# Altium project MD040EVM_RevE2.PrjPCB (part 4 of 4)
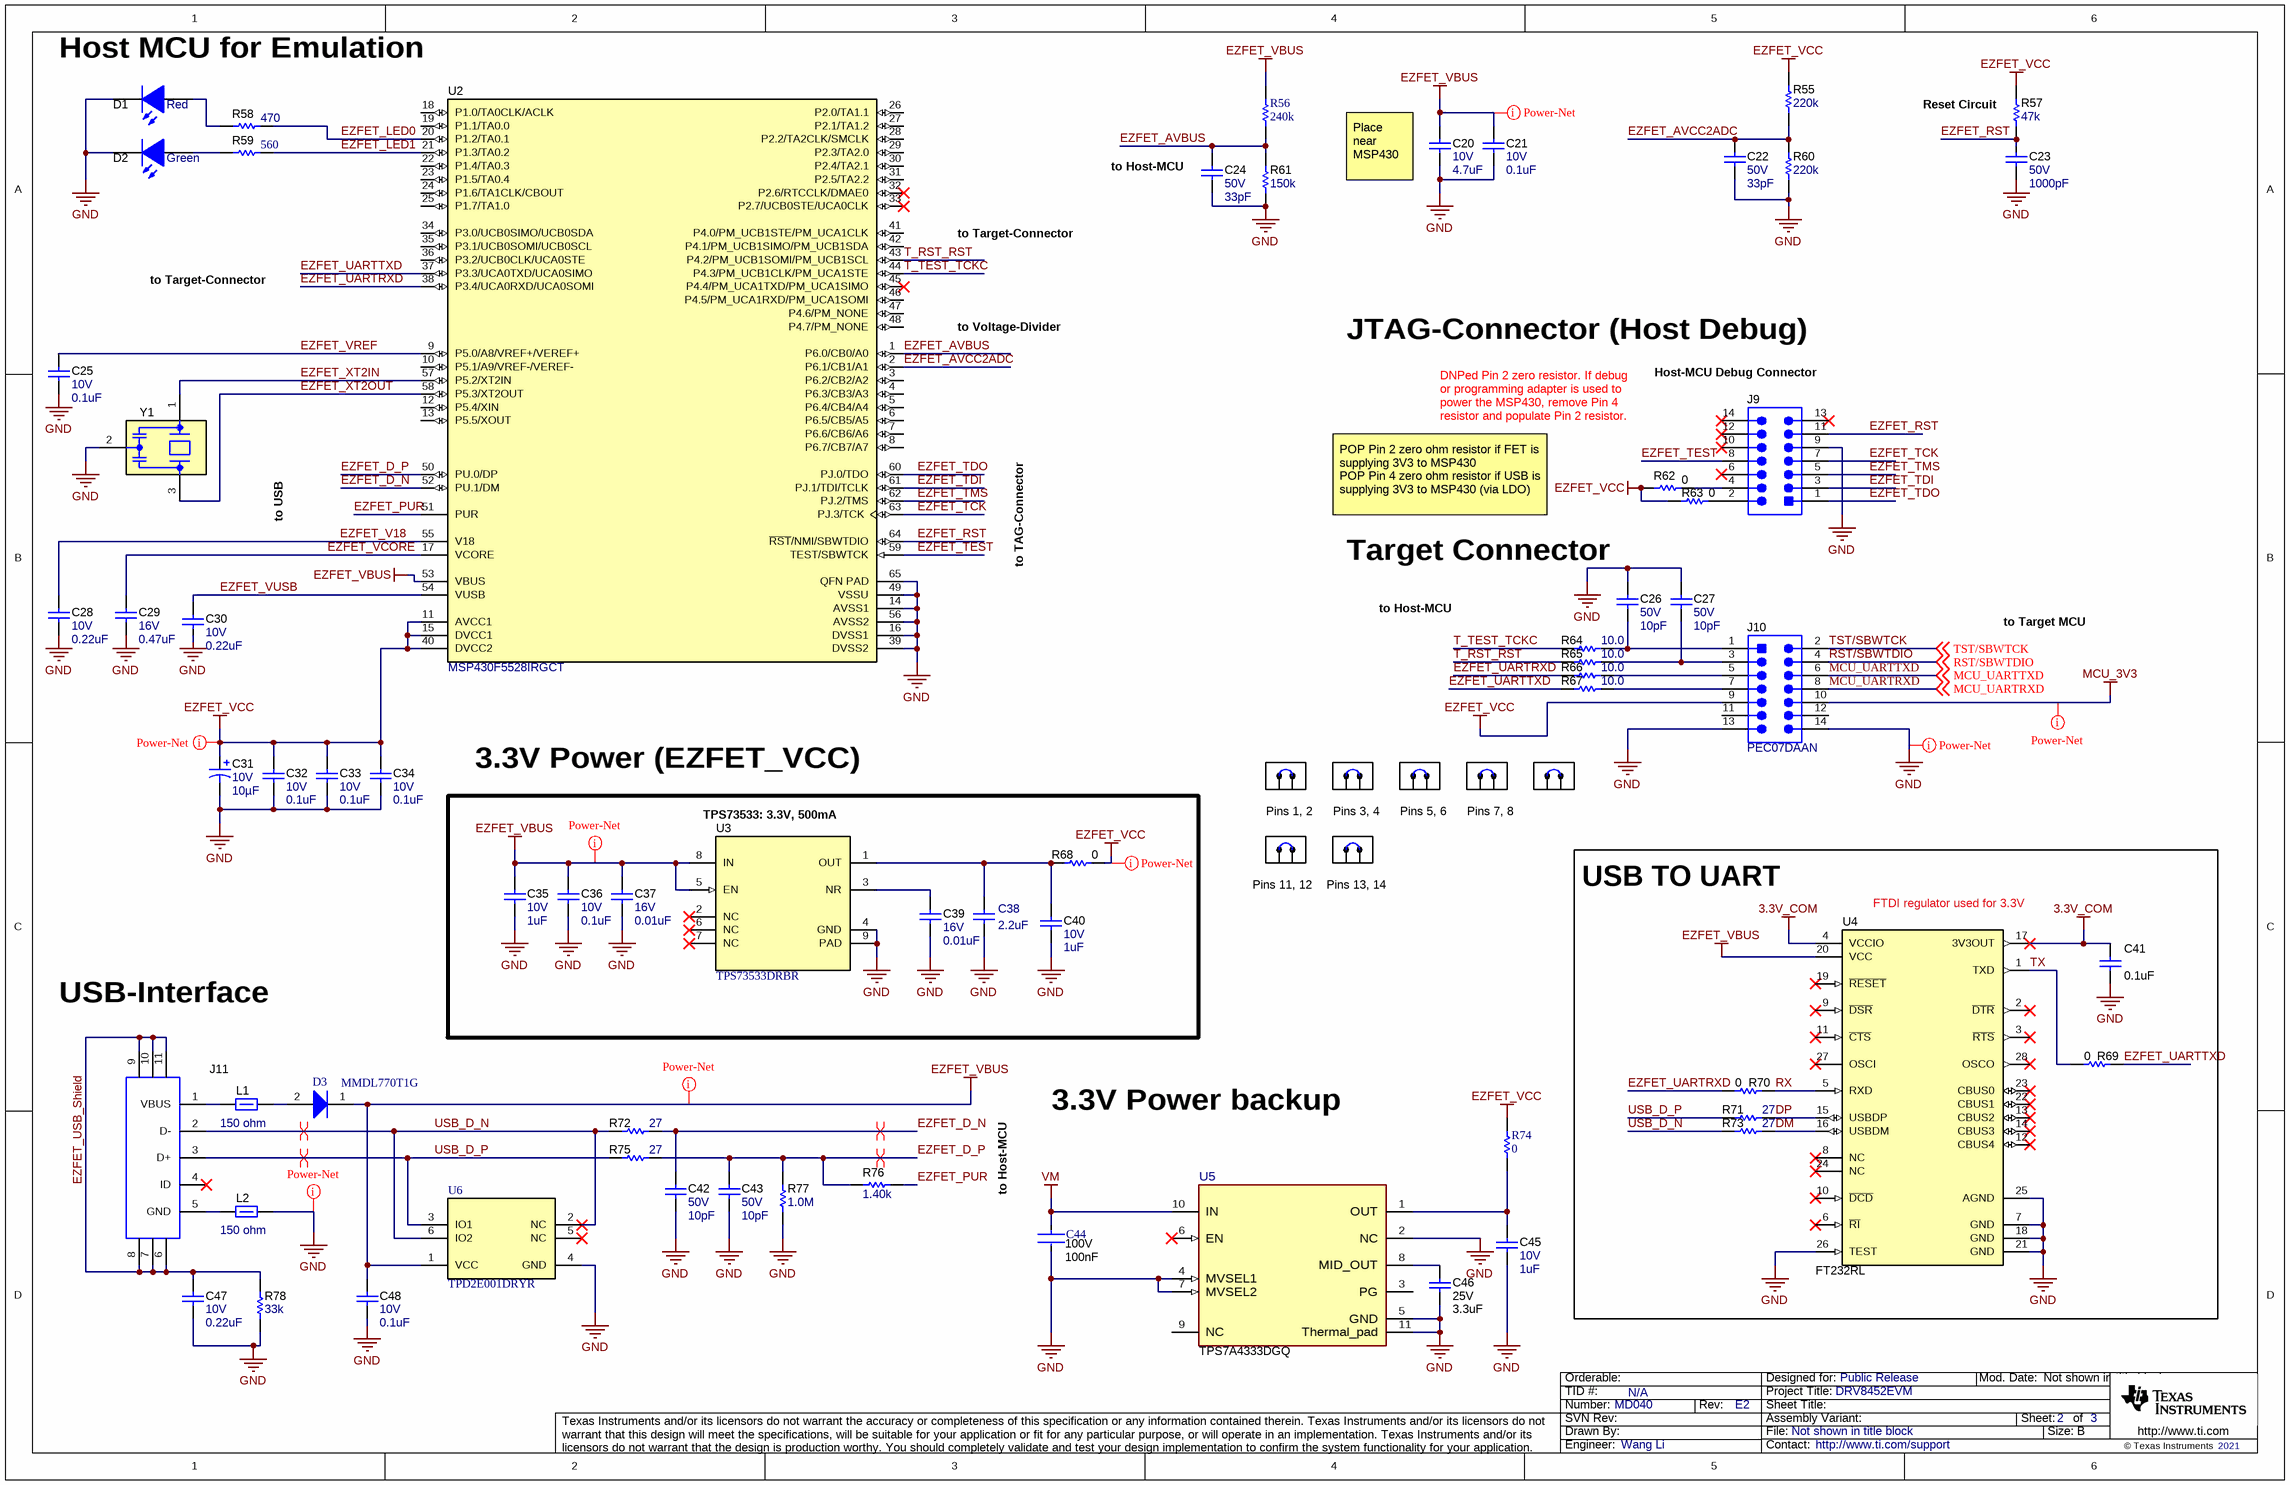
[diagram p4: MD040_ezFET_RevE2.SchDoc]

## Assembly variants
001: not fitted A1 A2 A4 C1 C2 C3 C4 C5 C6 C41 C44 C45 C46 C72 C73 J1 J2 J3 J22 J24 R1 R6 R7 R9 R10 R11 R12 R14 R15 R17 R18 R21 R22 R23 R24 R25 R26 R27 R30 R32 R33 R34 R54 R63 R69 R70 R71 R73 R74 R101 R103 R105 R106 R108 TP13 TP15 TP16 TP37 TP38 TP39 TP40 TP41 TP42 TP43 TP44 TP45 TP46 U4 U5 Y2
002: not fitted A1 A2 A4 C1 C2 C3 C4 C5 C6 C41 C44 C45 C46 C72 C73 J1 J2 J3 J16 J17 J18 J19 J20 J22 J24 R1 R6 R7 R9 R10 R11 R12 R14 R15 R17 R18 R21 R22 R23 R24 R25 R26 R27 R30 R32 R33 R34 R54 R69 R70 R71 R73 R74 R79 R80 R81 R82 R84 R85 R86 R87 R88 R102 R103 R105 R106 R107 TP13 TP15 TP16 TP37 TP38 TP39 TP40 TP41 TP42 TP43 TP44 TP45 TP46 U4 U5 Y2; alternate parts U7 -> CMP-0094066-1, D10 -> CMP-0002894-2, D11 -> CMP-0002894-2, D12 -> CMP-0002893-1
003: not fitted A1 A2 A3 A4 C1 C2 C3 C4 C5 C6 C41 C44 C45 C46 C72 C73 J1 J2 J3 J22 J24 R1 R2 R3 R6 R7 R9 R10 R11 R12 R14 R15 R17 R18 R21 R22 R23 R24 R25 R26 R27 R30 R32 R33 R34 R54 R69 R70 R71 R73 R74 R99 R100 R101 R103 R108 TP13 TP15 TP16 TP37 TP38 TP39 TP40 TP41 TP42 TP43 TP44 TP45 TP46 U4 U5 Y2; alternate parts U7 -> CMP-0094067-2
004: not fitted A1 A2 A3 A4 C1 C2 C3 C4 C5 C6 C41 C44 C45 C46 C72 C73 J1 J2 J3 J22 J24 R1 R2 R3 R6 R7 R9 R10 R11 R12 R14 R15 R17 R18 R21 R22 R23 R24 R25 R26 R27 R30 R32 R33 R34 R54 R69 R70 R71 R73 R74 R88 R99 R100 R102 R103 R107 TP13 TP15 TP16 TP37 TP38 TP39 TP40 TP41 TP42 TP43 TP44 TP45 TP46 U4 U5 Y2; alternate parts U7 -> CMP-0094068-2
005: not fitted A1 A2 A3 A4 C1 C2 C3 C4 C5 C6 C41 C44 C45 C46 C72 C73 J1 J2 J3 J22 J24 R1 R2 R3 R6 R7 R9 R10 R11 R12 R14 R15 R17 R18 R21 R22 R23 R24 R25 R26 R27 R30 R32 R33 R34 R54 R69 R70 R71 R73 R74 R99 R101 R103 R106 R108 TP13 TP15 TP16 TP37 TP38 TP39 TP40 TP41 TP42 TP43 TP44 TP45 TP46 U4 U5 Y2; alternate parts U7 -> CMP-0094063-2
006: not fitted A1 A2 A3 A4 C1 C2 C3 C4 C5 C6 C41 C44 C45 C46 C72 C73 J1 J2 J3 J16 J19 J20 J22 J24 R1 R3 R6 R7 R9 R10 R11 R12 R14 R15 R17 R18 R21 R22 R23 R24 R25 R26 R27 R30 R32 R33 R34 R54 R69 R70 R71 R73 R74 R79 R82 R84 R87 R99 R102 R103 R106 R107 TP13 TP15 TP16 TP37 TP38 TP39 TP40 TP41 TP42 TP43 TP44 TP45 TP46 U4 U5 Y2; alternate parts U7 -> CMP-0094065-2